# Altium schematic sheet RJ45.SchDoc: Ethernet (part 1 of 2)
size A3; Organization: Altium Limited; Address1: L3, 12a Rodborough Rd; Address2: Frenchs Forest; Address3: NSW; Address4: Australia 2086
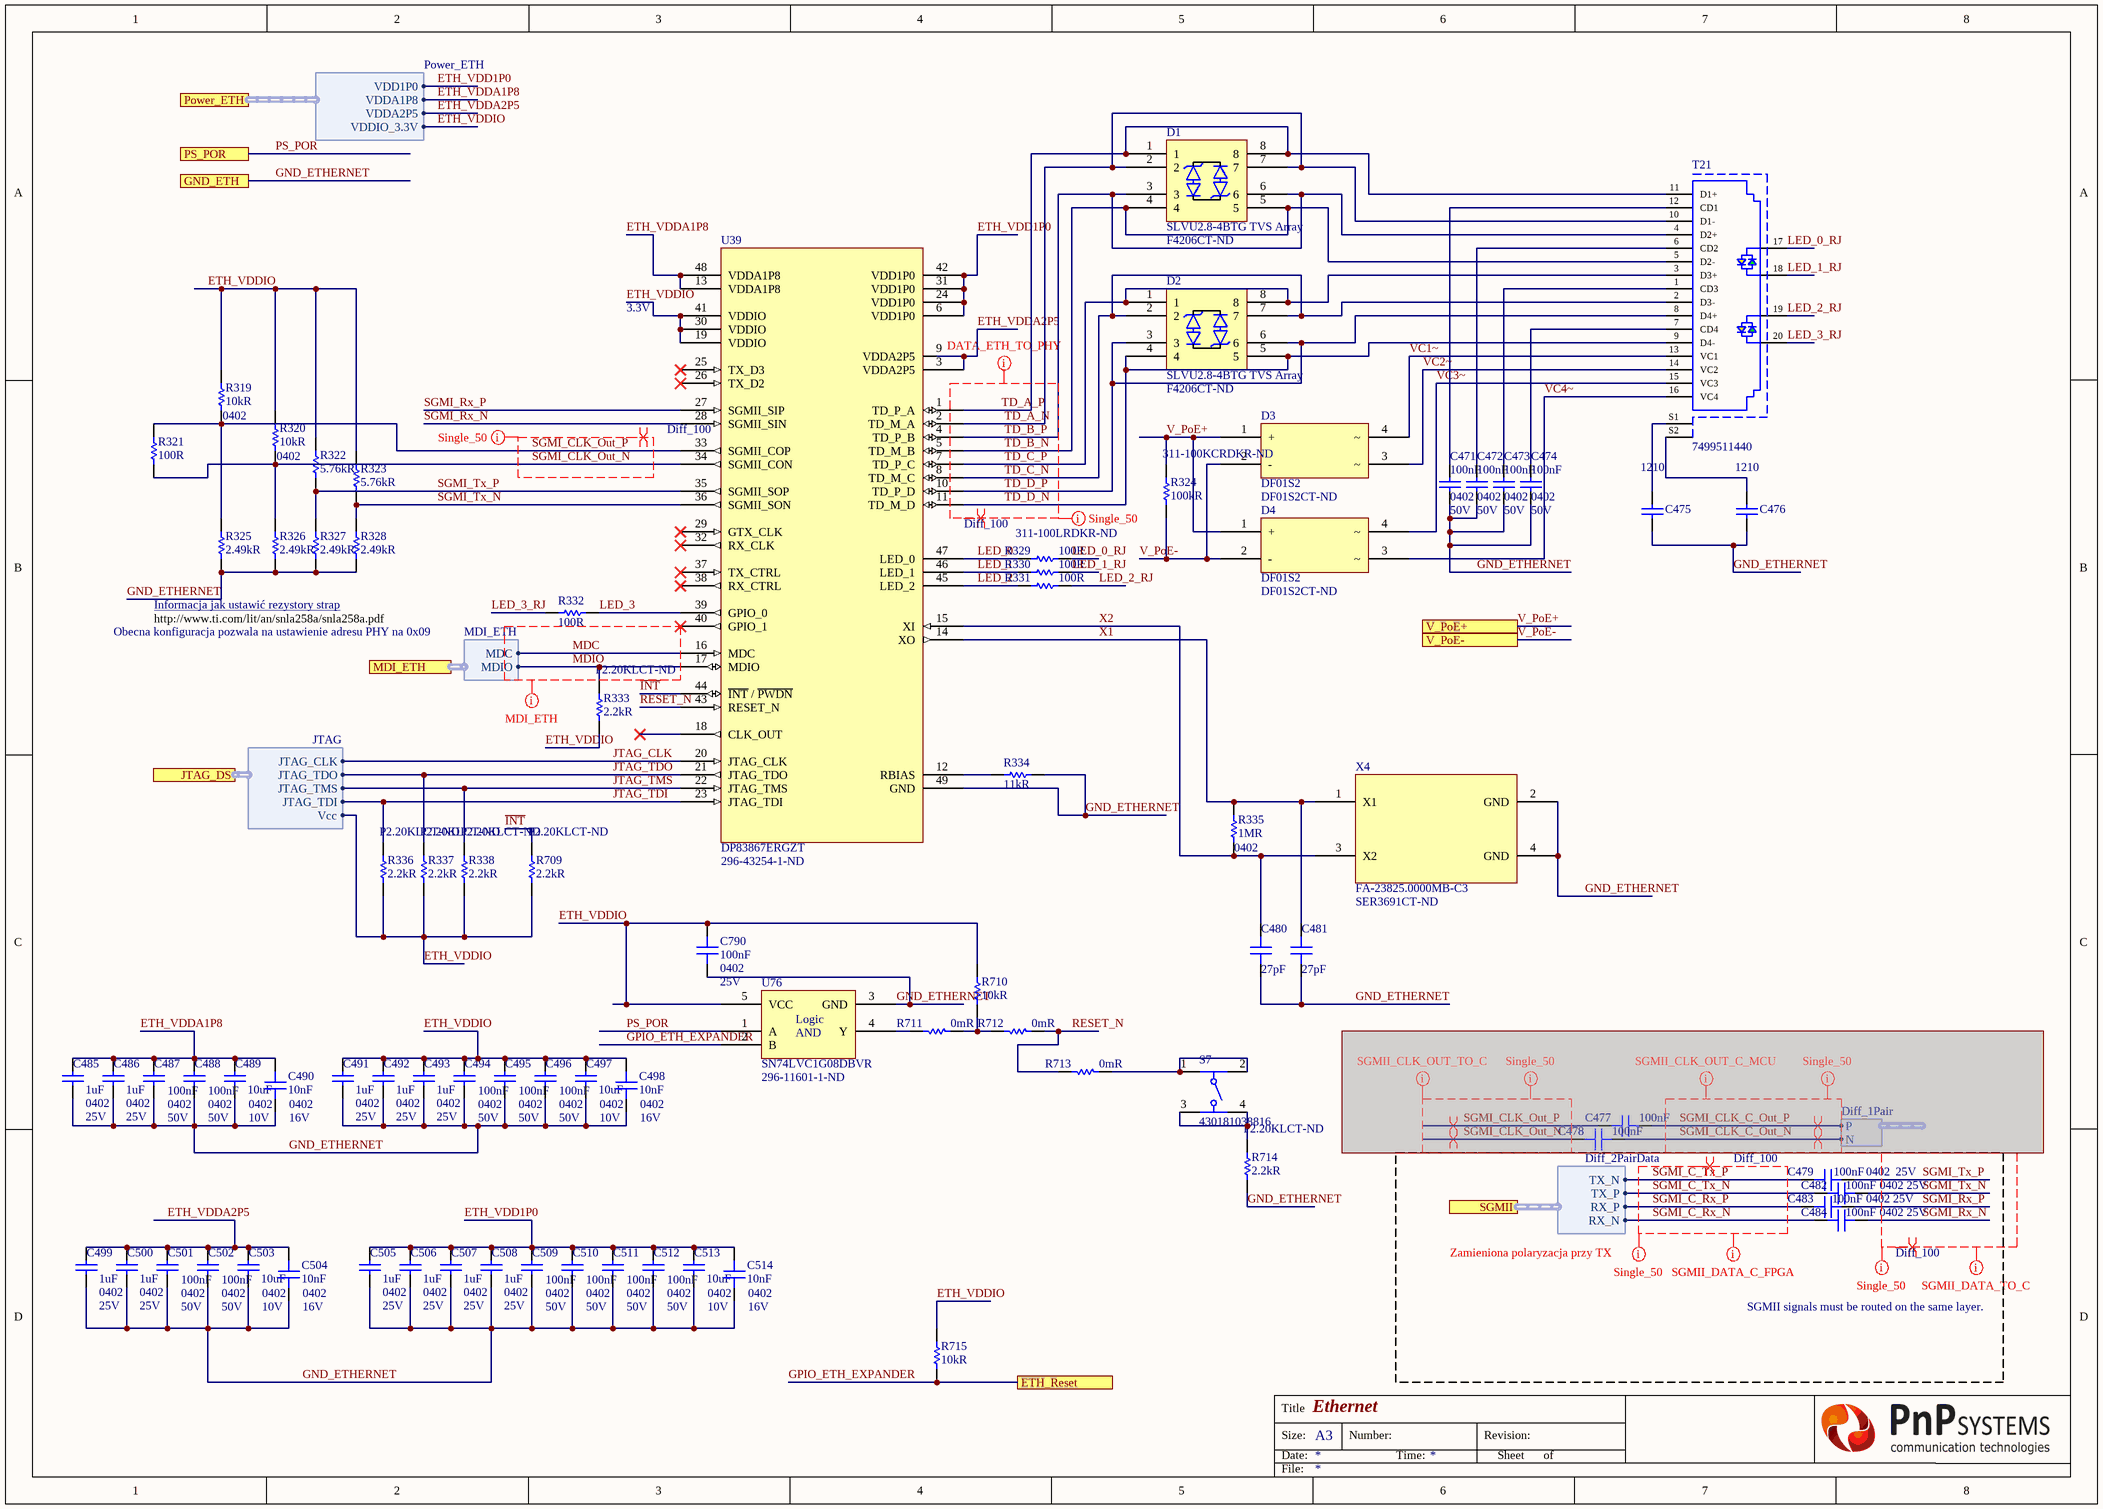
[diagram p0: RJ45.SchDoc]

## Parts
C471  100nF  Case Code (Imperial): 0402  Voltage: 50V  [CAP 0402/1005 KK]
C472  100nF  Case Code (Imperial): 0402  Voltage: 50V  [CAP 0402/1005 KK]
C473  100nF  Case Code (Imperial): 0402  Voltage: 50V  [CAP 0402/1005 KK]
C474  100nF  Case Code (Imperial): 0402  Voltage: 50V  [CAP 0402/1005 KK]
C475  Case/Package: 1210  [CAPC3326X17L]  (hidden comment: Capacitor_1210)
C476  Case/Package: 1210  [CAPC3326X17L]  (hidden comment: Capacitor_1210)
C477  100nF  [CAP 0402/1005 KK]  (masked out: inside a compile mask, not in the netlist)
C478  100nF  [CAP 0402/1005 KK]  (masked out: inside a compile mask, not in the netlist)
C479  100nF  Case/Package: 0402  Voltage Rating: 25V  [CAP 0402/1005 KK]
C480  27pF  [CAP 0402/1005 KK]
C481  27pF  [CAP 0402/1005 KK]
C482  100nF  Case/Package: 0402  Voltage Rating: 25V  [CAP 0402/1005 KK]
C483  100nF  Case/Package: 0402  Voltage Rating: 25V  [CAP 0402/1005 KK]
C484  100nF  Case/Package: 0402  Voltage Rating: 25V  [CAP 0402/1005 KK]
C485  1uF  Case/Package: 0402  Voltage Rating: 25V  [CAP 0402/1005 KK]
C486  1uF  Case/Package: 0402  Voltage Rating: 25V  [CAP 0402/1005 KK]
C487  100nF  Case Code (Imperial): 0402  Voltage: 50V  [CAP 0402/1005 KK]
C488  100nF  Case Code (Imperial): 0402  Voltage: 50V  [CAP 0402/1005 KK]
C489  10uF  Case/Package: 0402  Voltage Rating: 10V  [CAP 0402/1005 KK]
C490  10nF  Case/Package: 0402  Voltage Rating (DC): 16V  [CAP 0402/1005 KK]
C491  1uF  Case/Package: 0402  Voltage Rating: 25V  [CAP 0402/1005 KK]
C492  1uF  Case/Package: 0402  Voltage Rating: 25V  [CAP 0402/1005 KK]
C493  1uF  Case/Package: 0402  Voltage Rating: 25V  [CAP 0402/1005 KK]
C494  100nF  Case Code (Imperial): 0402  Voltage: 50V  [CAP 0402/1005 KK]
C495  100nF  Case Code (Imperial): 0402  Voltage: 50V  [CAP 0402/1005 KK]
C496  100nF  Case Code (Imperial): 0402  Voltage: 50V  [CAP 0402/1005 KK]
C497  10uF  Case/Package: 0402  Voltage Rating: 10V  [CAP 0402/1005 KK]
C498  10nF  Case/Package: 0402  Voltage Rating (DC): 16V  [CAP 0402/1005 KK]
C499  1uF  Case/Package: 0402  Voltage Rating: 25V  [CAP 0402/1005 KK]
C500  1uF  Case/Package: 0402  Voltage Rating: 25V  [CAP 0402/1005 KK]
C501  100nF  Case Code (Imperial): 0402  Voltage: 50V  [CAP 0402/1005 KK]
C502  100nF  Case Code (Imperial): 0402  Voltage: 50V  [CAP 0402/1005 KK]
C503  10uF  Case/Package: 0402  Voltage Rating: 10V  [CAP 0402/1005 KK]
C504  10nF  Case/Package: 0402  Voltage Rating (DC): 16V  [CAP 0402/1005 KK]
C505  1uF  Case/Package: 0402  Voltage Rating: 25V  [CAP 0402/1005 KK]
C506  1uF  Case/Package: 0402  Voltage Rating: 25V  [CAP 0402/1005 KK]
C507  1uF  Case/Package: 0402  Voltage Rating: 25V  [CAP 0402/1005 KK]
C508  1uF  Case/Package: 0402  Voltage Rating: 25V  [CAP 0402/1005 KK]
C509  100nF  Case Code (Imperial): 0402  Voltage: 50V  [CAP 0402/1005 KK]
C510  100nF  Case Code (Imperial): 0402  Voltage: 50V  [CAP 0402/1005 KK]
C511  100nF  Case Code (Imperial): 0402  Voltage: 50V  [CAP 0402/1005 KK]
C512  100nF  Case Code (Imperial): 0402  Voltage: 50V  [CAP 0402/1005 KK]
C513  10uF  Case/Package: 0402  Voltage Rating: 10V  [CAP 0402/1005 KK]
C514  10nF  Case/Package: 0402  Voltage Rating (DC): 16V  [CAP 0402/1005 KK]
C790  100nF  Case/Package: 0402  Voltage Rating: 25V  [CAP 0402/1005 KK]
D1  SLVU2.8-4BTG TVS Array  Supplier Part Number 1: F4206CT-ND  [SLVU2.8-4]
D2  SLVU2.8-4BTG TVS Array  Supplier Part Number 1: F4206CT-ND  [SLVU2.8-4]
D3  DF01S2  Supplier Part Number 1: DF01S2CT-ND  [DF005S2 - DF10S2]
D4  DF01S2  Supplier Part Number 1: DF01S2CT-ND  [DF005S2 - DF10S2]
R319  10kR  Case/Package: 0402  [RES 0402/1005 RF KK]
R320  10kR  Case/Package: 0402  [RES 0402/1005 RF KK]
R321  100R  [RES 0402/1005 RF KK]
R322  5.76kR  [RES 0402/1005 RF KK]
R323  5.76kR  [RES 0402/1005 RF KK]
R324  100kR  Supplier Part Number 1: 311-100KCRDKR-ND  [RES 0805/2012 RF]
R325  2.49kR  [RES 0402/1005 RF KK]
R326  2.49kR  [RES 0402/1005 RF KK]
R327  2.49kR  [RES 0402/1005 RF KK]
R328  2.49kR  [RES 0402/1005 RF KK]
R329  100R  Supplier Part Number 1: 311-100LRDKR-ND  [RES 0402/1005 RF KK]
R330  100R  [RES 0402/1005 RF KK]
R331  100R  [RES 0402/1005 RF KK]
R332  100R  [RES 0402/1005 RF KK]
R333  2.2kR  Supplier Part Number 1: P2.20KLCT-ND  [RES 0402/1005 RF KK]
R334  11kR  [RES 0402/1005 RF KK]
R335  1MR  Case/Package: 0402  [RES 0402/1005 RF KK]
R336  2.2kR  Supplier Part Number 1: P2.20KLCT-ND  [RES 0402/1005 RF KK]
R337  2.2kR  Supplier Part Number 1: P2.20KLCT-ND  [RES 0402/1005 RF KK]
R338  2.2kR  Supplier Part Number 1: P2.20KLCT-ND  [RES 0402/1005 RF KK]
R709  2.2kR  Supplier Part Number 1: P2.20KLCT-ND  [RES 0402/1005 RF KK]
R710  10kR  [RES 0402/1005 RF KK]
R711  0mR  [RES 0402/1005 RF KK]
R712  0mR  [RES 0402/1005 RF KK]
R713  0mR  [RES 0402/1005 RF KK]
R714  2.2kR  Supplier Part Number 1: P2.20KLCT-ND  [RES 0402/1005 RF KK]
R715  10kR  [RES 0402/1005 RF KK]
S7  430181038816  [430181038816]
T21  7499511440  [7499511440]
U39  DP83867ERGZT  Supplier Part Number 1: 296-43254-1-ND  [DP83867E]
U76  SN74LVC1G08DBVR  Supplier Part Number 1: 296-11601-1-ND  [SN74LVC1G08DBVR]
X4  FA-23825.0000MB-C3  Supplier Part Number 1: SER3691CT-ND  [FA-23825.0000MB-C3]

## Ports
ETH_Reset, GND_ETH, JTAG_DS (harness JTAG), MDI_ETH (harness MDI_ETH), Power_ETH (harness Power_ETH), PS_POR, SGMII (harness Diff_2PairData), V_PoE+, V_PoE-

## Harnesses
Diff_2PairData: RX_P, RX_N, TX_P, TX_N
Diff_1Pair: P, N
Power_ETH: VDD1P0, VDDA1P8, VDDA2P5, VDDIO_3.3V
MDI_ETH: MDC, MDIO
JTAG: JTAG_CLK, JTAG_TDI, JTAG_TDO, JTAG_TMS, Vcc

## Nets
~{INT}: R709.2 U39.44(~{INT}_/_~{PWDN})
ETH_VDD1P0: C505.1 C506.1 C507.1 C508.1 C509.2 C510.2 C511.2 C512.2 C513.2 C514.2 U39.6(VDD1P0) U39.24(VDD1P0) U39.31(VDD1P0) U39.42(VDD1P0) ; port Power_ETH.VDD1P0
ETH_VDDA1P8: C485.1 C486.1 C487.2 C488.2 C489.2 C490.2 U39.13(VDDA1P8) U39.48(VDDA1P8) ; port Power_ETH.VDDA1P8
ETH_VDDA2P5: C499.1 C500.1 C501.2 C502.2 C503.2 C504.2 U39.3(VDDA2P5) U39.9(VDDA2P5) ; port Power_ETH.VDDA2P5
ETH_VDDIO: C491.1 C492.1 C493.1 C494.2 C495.2 C496.2 C497.2 C498.2 C790.1 R319.2 R320.2 R322.2 R323.2 R333.1 R336.1 R337.1 R338.1 R709.1 R710.2 R715.2 U39.19(VDDIO) U39.30(VDDIO) U39.41(VDDIO) U76.5(VCC) ; port Power_ETH.VDDIO_3.3V, port JTAG_DS.Vcc
GND_ETHERNET: C471.1 C472.1 C473.1 C474.1 C475.1 C476.1 C480.1 C481.1 C485.2 C486.2 C487.1 C488.1 C489.1 C490.1 C491.2 C492.2 C493.2 C494.1 C495.1 C496.1 C497.1 C498.1 C499.2 C500.2 C501.1 C502.1 C503.1 C504.1 C505.2 C506.2 C507.2 C508.2 C509.1 C510.1 C511.1 C512.1 C513.1 C514.1 C790.2 R325.1 R326.1 R327.1 R328.1 R334.2 R714.1 U39.49(GND) U76.3(GND) X4.2(GND) X4.4(GND) ; port GND_ETH
GPIO_ETH_EXPANDER: R715.1 U76.2(B) ; port ETH_Reset
JTAG_CLK: U39.20(JTAG_CLK) ; port JTAG_DS.JTAG_CLK
JTAG_TDI: R336.2 U39.23(JTAG_TDI) ; port JTAG_DS.JTAG_TDI
JTAG_TDO: R337.2 U39.21(JTAG_TDO) ; port JTAG_DS.JTAG_TDO
JTAG_TMS: R338.2 U39.22(JTAG_TMS) ; port JTAG_DS.JTAG_TMS
LED_0: R329.1 U39.47(LED_0)
LED_0_RJ: R329.2 T21.17
LED_1: R330.1 U39.46(LED_1)
LED_1_RJ: R330.2 T21.18
LED_2: R331.1 U39.45(LED_2)
LED_2_RJ: R331.2 T21.19
LED_3: R332.2 U39.39(GPIO_0)
LED_3_RJ: R332.1 T21.20
MDC: U39.16(MDC) ; port MDI_ETH.MDC
MDIO: R333.2 U39.17(MDIO) ; port MDI_ETH.MDIO
PS_POR: U76.1(A) ; port PS_POR
RESET_N: R712.1 R713.2 U39.43(RESET_N)
SGMI_C_Rx_N: C484.2 ; port SGMII.RX_N
SGMI_C_Rx_P: C483.2 ; port SGMII.RX_P
SGMI_C_Tx_N: C482.2 ; port SGMII.TX_P
SGMI_C_Tx_P: C479.2 ; port SGMII.TX_N
SGMI_CLK_Out_N: R320.1 R321.1 R326.2 U39.34(SGMII_CON)
SGMI_CLK_Out_P: R319.1 R321.2 R325.2 U39.33(SGMII_COP)
SGMI_Rx_N: C484.1 U39.28(SGMII_SIN)
SGMI_Rx_P: C483.1 U39.27(SGMII_SIP)
SGMI_Tx_N: C482.1 R323.1 R328.2 U39.36(SGMII_SON)
SGMI_Tx_P: C479.1 R322.1 R327.2 U39.35(SGMII_SOP)
TD_A_N: D1.2 D1.7 T21.10(D1-) U39.2(TD_M_A)
TD_A_P: D1.1 D1.8 T21.11(D1+) U39.1(TD_P_A)
TD_B_N: D1.4 D1.5 T21.5(D2-) U39.5(TD_M_B)
TD_B_P: D1.3 D1.6 T21.4(D2+) U39.4(TD_P_B)
TD_C_N: D2.2 D2.7 T21.2(D3-) U39.8(TD_M_C)
TD_C_P: D2.1 D2.8 T21.3(D3+) U39.7(TD_P_C)
TD_D_N: D2.4 D2.5 T21.9(D4-) U39.11(TD_M_D)
TD_D_P: D2.3 D2.6 T21.8(D4+) U39.10(TD_P_D)
V_PoE+: D3.1(+) D4.1(+) R324.2 ; port V_PoE+
V_PoE-: D3.2(-) D4.2(-) R324.1 ; port V_PoE-
VC1~: D3.4 T21.13(VC1)
VC2~: D3.3 T21.14(VC2)
VC3~: D4.4 T21.15(VC3)
VC4~: D4.3 T21.16(VC4)
X1: C481.2 R335.2 U39.14(XO) X4.1(X1)
X2: C480.2 R335.1 U39.15(XI) X4.3(X2)
NetC471_2: C471.2 T21.12(CD1)
NetC472_2: C472.2 T21.6(CD2)
NetC473_2: C473.2 T21.1(CD3)
NetC474_2: C474.2 T21.7(CD4)
NetC475_2: C475.2 T21.S1(Shield)
NetC476_2: C476.2 T21.S2(Shield)
NetR334_1: R334.1 U39.12(RBIAS)
NetR710_1: R710.1 R711.1 R712.2
NetR711_2: R711.2 U76.4(Y)
NetR713_1: R713.1 S7.1 S7.2
NetR714_2: R714.2 S7.3 S7.4

Not connected (* = marked no-connect by the designer): U39 18(CLK_OUT)* 25(TX_D3)* 26(TX_D2)* 29(GTX_CLK)* 32(RX_CLK)* 37(TX_CTRL)* 38(RX_CTRL)* 40(GPIO_1)*

## Layout directives
differential pair; differential pair class Diff_100: SGMI_C_Rx_N, SGMI_C_Rx_P, SGMI_C_Tx_N, SGMI_C_Tx_P, SGMI_CLK_C_Out_N, SGMI_CLK_C_Out_P, SGMI_CLK_Out_N, SGMI_CLK_Out_P, SGMI_Rx_N, SGMI_Rx_P, SGMI_Tx_N, SGMI_Tx_P, TD_A_N, TD_A_P, TD_B_N, TD_B_P, TD_C_N, TD_C_P, TD_D_N, TD_D_P
net class DATA_ETH_TO_PHY: TD_A_N, TD_A_P, TD_B_N, TD_B_P, TD_C_N, TD_C_P, TD_D_N, TD_D_P
net class SGMIICLK_TO_CAP: SGMI_CLK_Out_N, SGMI_CLK_Out_P
net class SGMIICLK_CAP_TO_MCU: SGMI_CLK_C_Out_N, SGMI_CLK_C_Out_P
net class SGMII_DATA_C_FPGA: SGMI_C_Rx_N, SGMI_C_Rx_P, SGMI_C_Tx_N, SGMI_C_Tx_P
net class SGMII_DATA_TO_C: SGMI_Rx_N, SGMI_Rx_P, SGMI_Tx_N, SGMI_Tx_P
net class Single_50: SGMI_C_Rx_N, SGMI_C_Rx_P, SGMI_C_Tx_N, SGMI_C_Tx_P, SGMI_CLK_C_Out_N, SGMI_CLK_C_Out_P, SGMI_CLK_Out_N, SGMI_CLK_Out_P, SGMI_Rx_N, SGMI_Rx_P, SGMI_Tx_N, SGMI_Tx_P, TD_A_N, TD_A_P, TD_B_N, TD_B_P, TD_C_N, TD_C_P, TD_D_N, TD_D_P
net class MDI_ETH: MDC, MDIO

## Notes on the sheet
- 3.3V
- Obecna konfiguracja pozwala na ustawienie adresu PHY na 0x09
- http://www.ti.com/lit/an/snla258a/snla258a.pdf
- Informacja jak ustawić rezystory strap <http://www.ti.com/lit/an/snla258a/snla258a.pdf>
- Zamieniona polaryzacja przy TX
- SGMII signals must be routed on the same layer.
- Title
- Size:
- Date:
- A3
- Number:
- Time:
- Revision:
- Sheet
- of
- File:
- (in symbol SN74LVC1G08DBVR) Logic